# Altium schematic sheet PIEVISION TEMPLATE.SchDoc
size A3; Address1: Istanbul/Turkey; DocumentNumber: 2; SheetNumber: 7; SheetTotal: 20; Company: Pievision
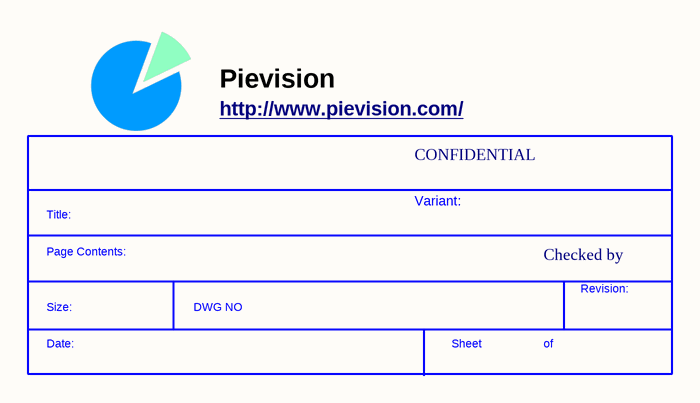
[diagram p0: PIEVISION TEMPLATE.SchDoc]

## Parts
*  SDTitleBlock  (value not drawn)  (graphical)

## Notes on the sheet
- Pievision
- http://www.pievision.com/
- CONFIDENTIAL
- Variant:
- Checked by
- (in symbol SDTitleBlock) Title:; Page Contents:; Revision:; Size:; DWG NO; Date:; Sheet; of